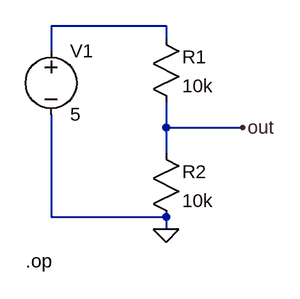
[diagram p0: schematic divider.asc]
divider.asc, the LTspice schematic file:
Version 4
SHEET 1 880 680
WIRE 64 64 64 96
WIRE 64 64 208 64
WIRE 208 64 208 80
WIRE 208 160 208 192
WIRE 208 192 304 192
WIRE 208 192 208 224
WIRE 64 176 64 304
WIRE 64 304 208 304
WIRE 208 304 208 320
FLAG 208 320 0
FLAG 304 192 out
SYMBOL voltage 64 80 R0
SYMATTR InstName V1
SYMATTR Value 5
SYMBOL res 192 64 R0
SYMATTR InstName R1
SYMATTR Value 10k
SYMBOL res 192 208 R0
SYMATTR InstName R2
SYMATTR Value 10k
TEXT 32 360 Left 2 !.op

The netlist it stands for:
* divider.asc
V1 N001 0 5
R1 N001 out 10k
R2 out 0 10k
.op
.backanno
.end